# Altium schematic sheet 27_Radar_PMIC_and_rail_filters.SchDoc
size 289 x 400 mm
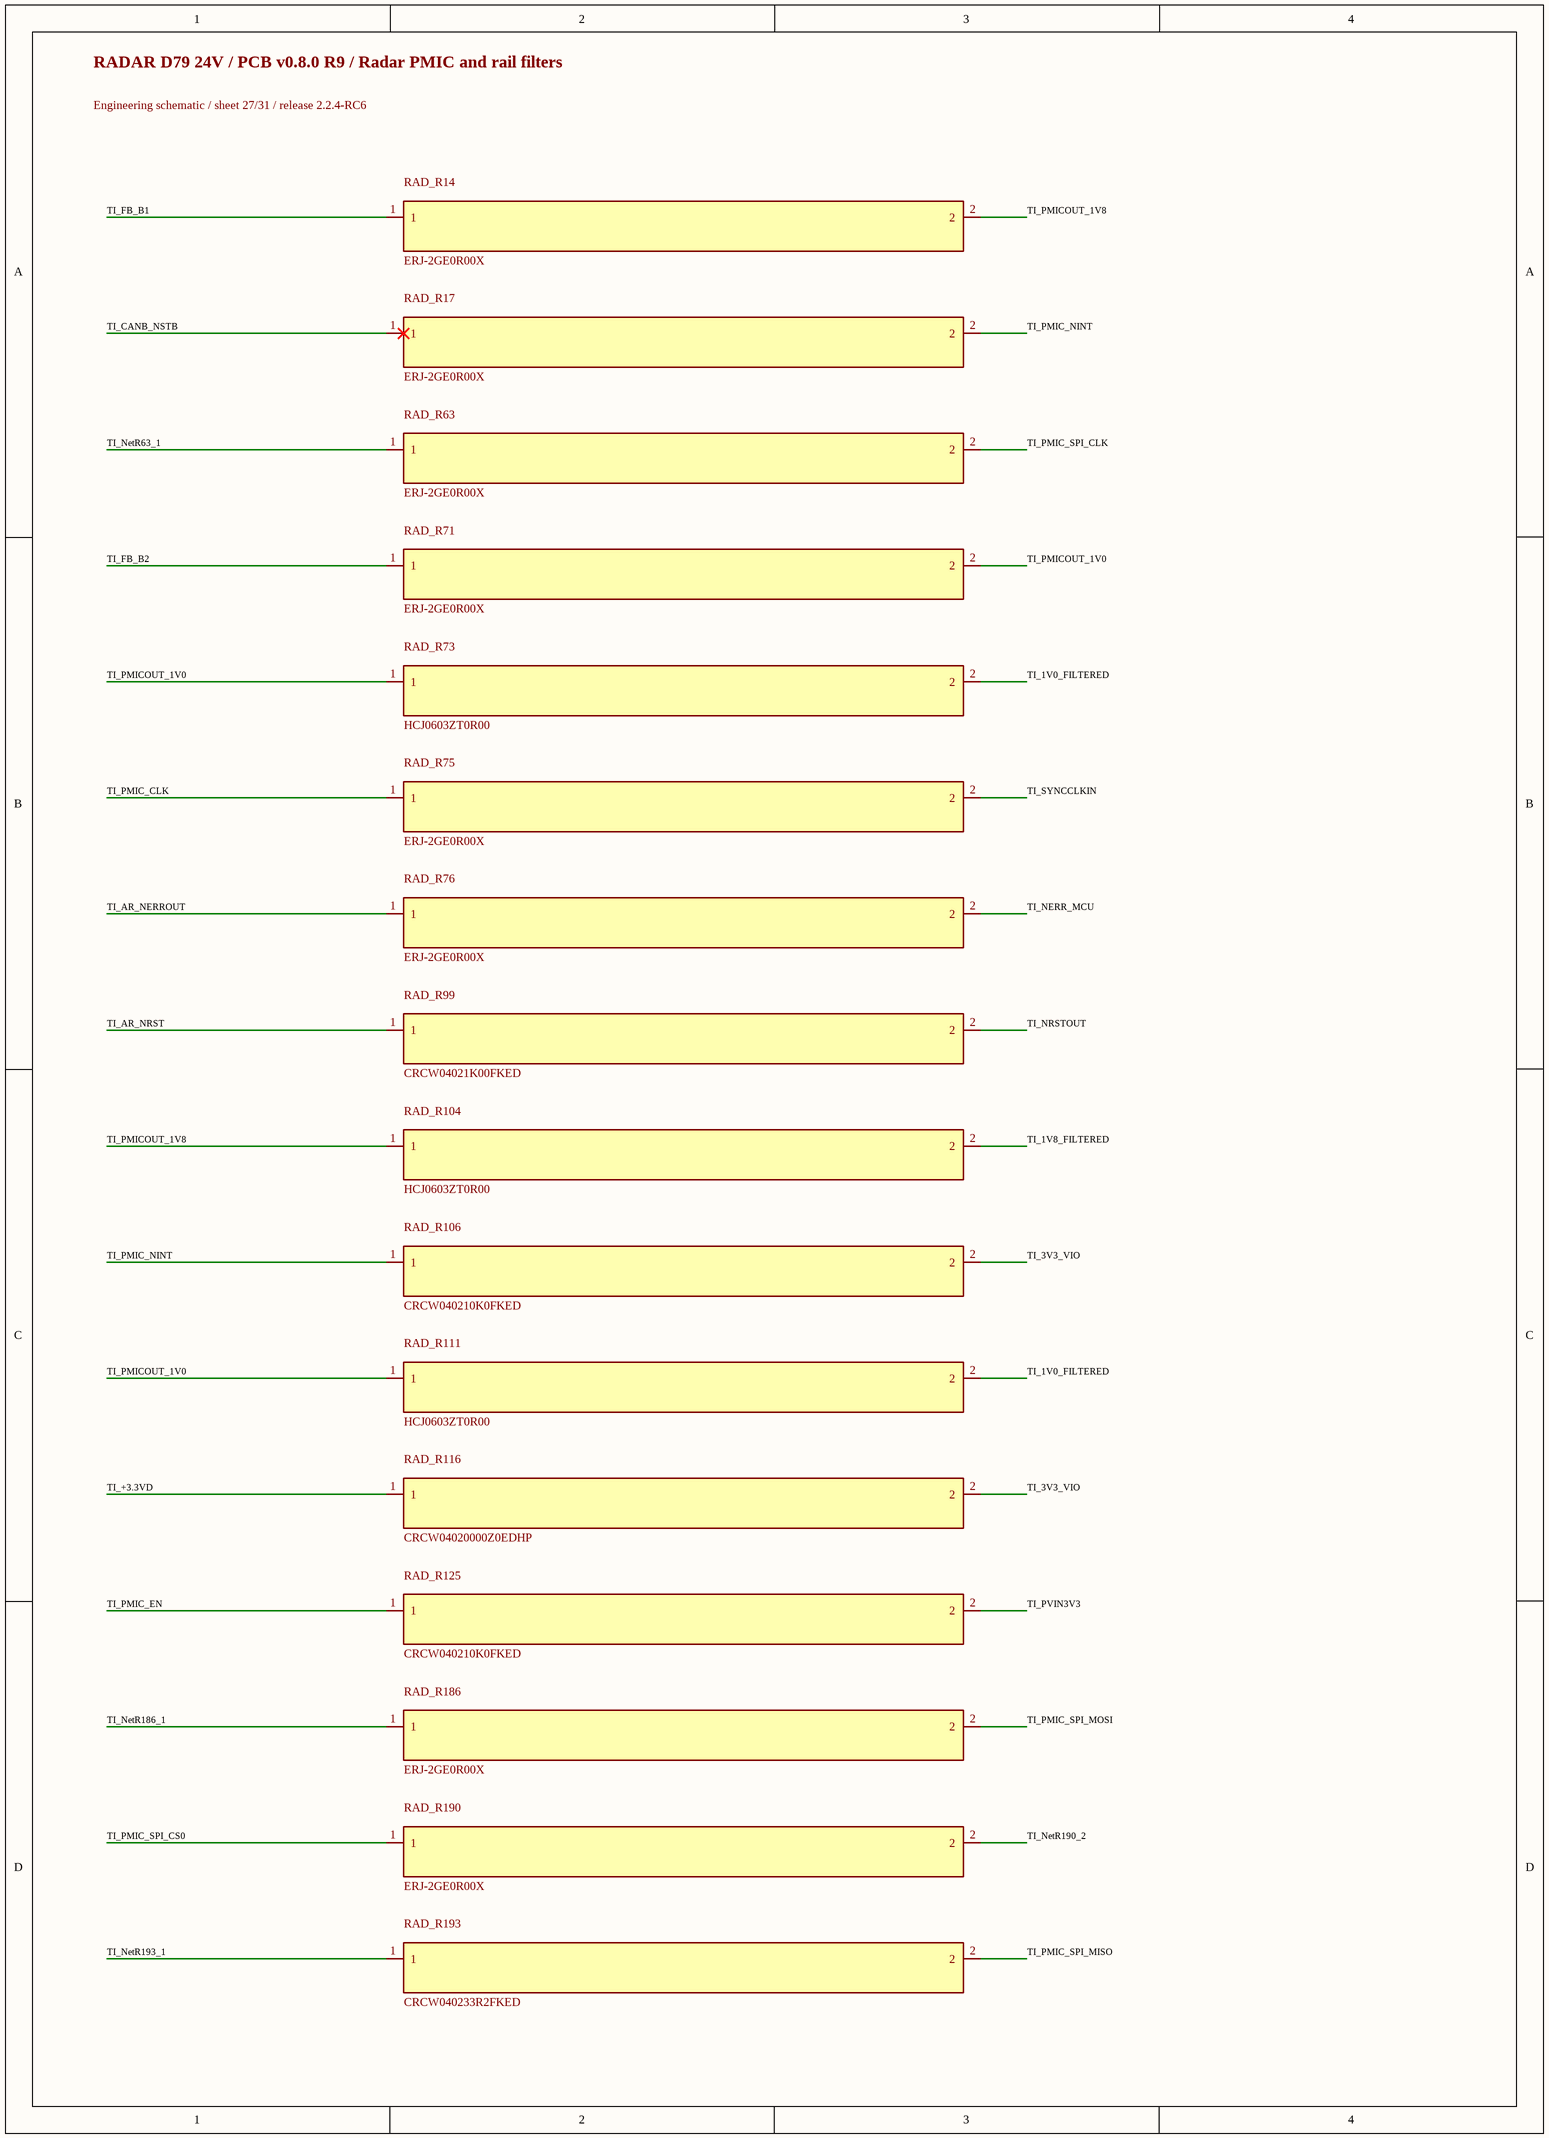
[diagram p0: 27_Radar_PMIC_and_rail_filters.SchDoc]

## Parts
RAD_R14  ERJ-2GE0R00X  [0402L]
RAD_R17  ERJ-2GE0R00X  [0402L]
RAD_R63  ERJ-2GE0R00X  [0402L]
RAD_R71  ERJ-2GE0R00X  [0402L]
RAD_R73  HCJ0603ZT0R00  [FP-HCJ0603ZT0R00_0603-MFG]
RAD_R75  ERJ-2GE0R00X  [0402L]
RAD_R76  ERJ-2GE0R00X  [0402L]
RAD_R99  CRCW04021K00FKED  [0402L]
RAD_R104  HCJ0603ZT0R00  [FP-HCJ0603ZT0R00_0603-MFG]
RAD_R106  CRCW040210K0FKED  [0402L]
RAD_R111  HCJ0603ZT0R00  [FP-HCJ0603ZT0R00_0603-MFG]
RAD_R116  CRCW04020000Z0EDHP  [0402L]
RAD_R125  CRCW040210K0FKED  [0402L]
RAD_R186  ERJ-2GE0R00X  [0402L]
RAD_R190  ERJ-2GE0R00X  [0402L]
RAD_R193  CRCW040233R2FKED  [0402L]

## Nets
TI_1V0_FILTERED: RAD_R73.2 RAD_R111.2
TI_1V8_FILTERED: RAD_R104.2
TI_3V3_VIO: RAD_R106.2 RAD_R116.2
TI_+3.3VD: RAD_R116.1
TI_AR_NERROUT: RAD_R76.1
TI_AR_NRST: RAD_R99.1
TI_CANB_NSTB: RAD_R17.1
TI_FB_B1: RAD_R14.1
TI_FB_B2: RAD_R71.1
TI_NERR_MCU: RAD_R76.2
TI_NetR63_1: RAD_R63.1
TI_NetR186_1: RAD_R186.1
TI_NetR190_2: RAD_R190.2
TI_NetR193_1: RAD_R193.1
TI_NRSTOUT: RAD_R99.2
TI_PMIC_CLK: RAD_R75.1
TI_PMIC_EN: RAD_R125.1
TI_PMIC_NINT: RAD_R17.2 RAD_R106.1
TI_PMIC_SPI_CLK: RAD_R63.2
TI_PMIC_SPI_CS0: RAD_R190.1
TI_PMIC_SPI_MISO: RAD_R193.2
TI_PMIC_SPI_MOSI: RAD_R186.2
TI_PMICOUT_1V0: RAD_R71.2 RAD_R73.1 RAD_R111.1
TI_PMICOUT_1V8: RAD_R14.2 RAD_R104.1
TI_PVIN3V3: RAD_R125.2
TI_SYNCCLKIN: RAD_R75.2

## Notes on the sheet
- RADAR D79 24V / PCB v0.8.0 R9 / Radar PMIC and rail filters
- Engineering schematic / sheet 27/31 / release 2.2.4-RC6